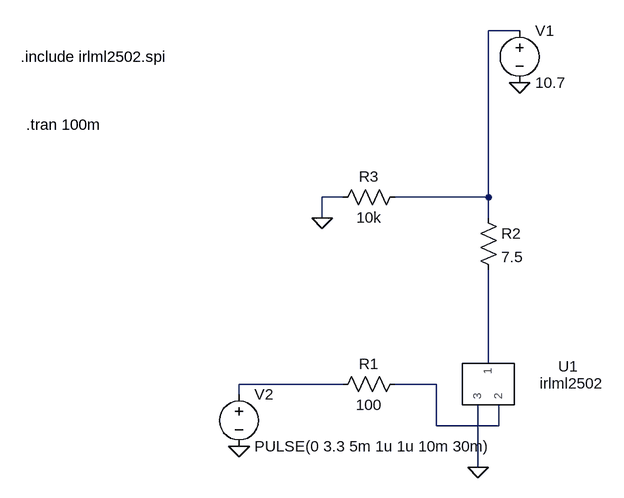
[diagram p0: schematic PowerSimsasc.asc]
PowerSimsasc.asc, the LTspice schematic file:
Version 4.1
SHEET 1 880 680
WIRE 400 -144 352 -144
WIRE 128 112 96 112
WIRE 352 112 352 -144
WIRE 352 112 208 112
WIRE 96 144 96 112
WIRE 352 144 352 112
WIRE 352 368 352 224
WIRE 128 400 -32 400
WIRE 272 400 208 400
WIRE -32 416 -32 400
WIRE 272 464 272 400
WIRE 368 464 368 432
WIRE 368 464 272 464
WIRE 336 528 336 432
FLAG 336 528 0
FLAG 400 -64 0
FLAG -32 496 0
FLAG 96 144 0
SYMBOL irlml2502 352 400 R90
WINDOW 0 -43 -123 VTop 2
WINDOW 3 14 -128 VBottom 2
SYMATTR InstName U1
SYMBOL res 224 384 R90
WINDOW 0 0 56 VBottom 2
WINDOW 3 32 56 VTop 2
SYMATTR InstName R1
SYMATTR Value 100
SYMBOL res 336 128 R0
SYMATTR InstName R2
SYMATTR Value 7.5
SYMBOL res 224 96 R90
WINDOW 0 0 56 VBottom 2
WINDOW 3 32 56 VTop 2
SYMATTR InstName R3
SYMATTR Value 10k
SYMBOL voltage 400 -160 R0
WINDOW 123 0 0 Left 0
WINDOW 39 0 0 Left 0
SYMATTR InstName V1
SYMATTR Value 10.7
SYMBOL voltage -32 400 R0
WINDOW 123 0 0 Left 0
WINDOW 39 0 0 Left 0
SYMATTR InstName V2
SYMATTR Value PULSE(0 3.3 5m 1u 1u 10m 30m)
TEXT -368 -104 Left 2 !.include irlml2502.spi
TEXT -360 0 Left 2 !.tran 100m

The netlist it stands for:
* PowerSimsasc.asc
X§U1 N002 N004 0 irlml2502  ; pins 1 2 3
R1 N004 N003 100
R2 N001 N002 7.5
R3 N001 0 10k
V1 N001 0 10.7
V2 N003 0 PULSE(0 3.3 5m 1u 1u 10m 30m)
.include irlml2502.spi
.tran 100m
.lib irlml2502.spi
.backanno
.end